# Altium schematic sheet esp32‑smart‑greenhouse.schdoc
size 309 x 223 mm; Symbol: Sheet-Symbol_A4; Device: Sheet-Symbol_A4; Company: 嘉立创EDA; Version: V1.0; Page Size: A4; @Project Name: ESP32-01-V1.05; @Page Count: 1; @Update Date: 2025-07-08; @Create Date: 2025-07-08; @Schematic Name: schematic1_1; @Page No: 1; @Page Name: P1; @Board Name: Board1; @Create Time: 15:48:50; @Update Time: 16:10:28
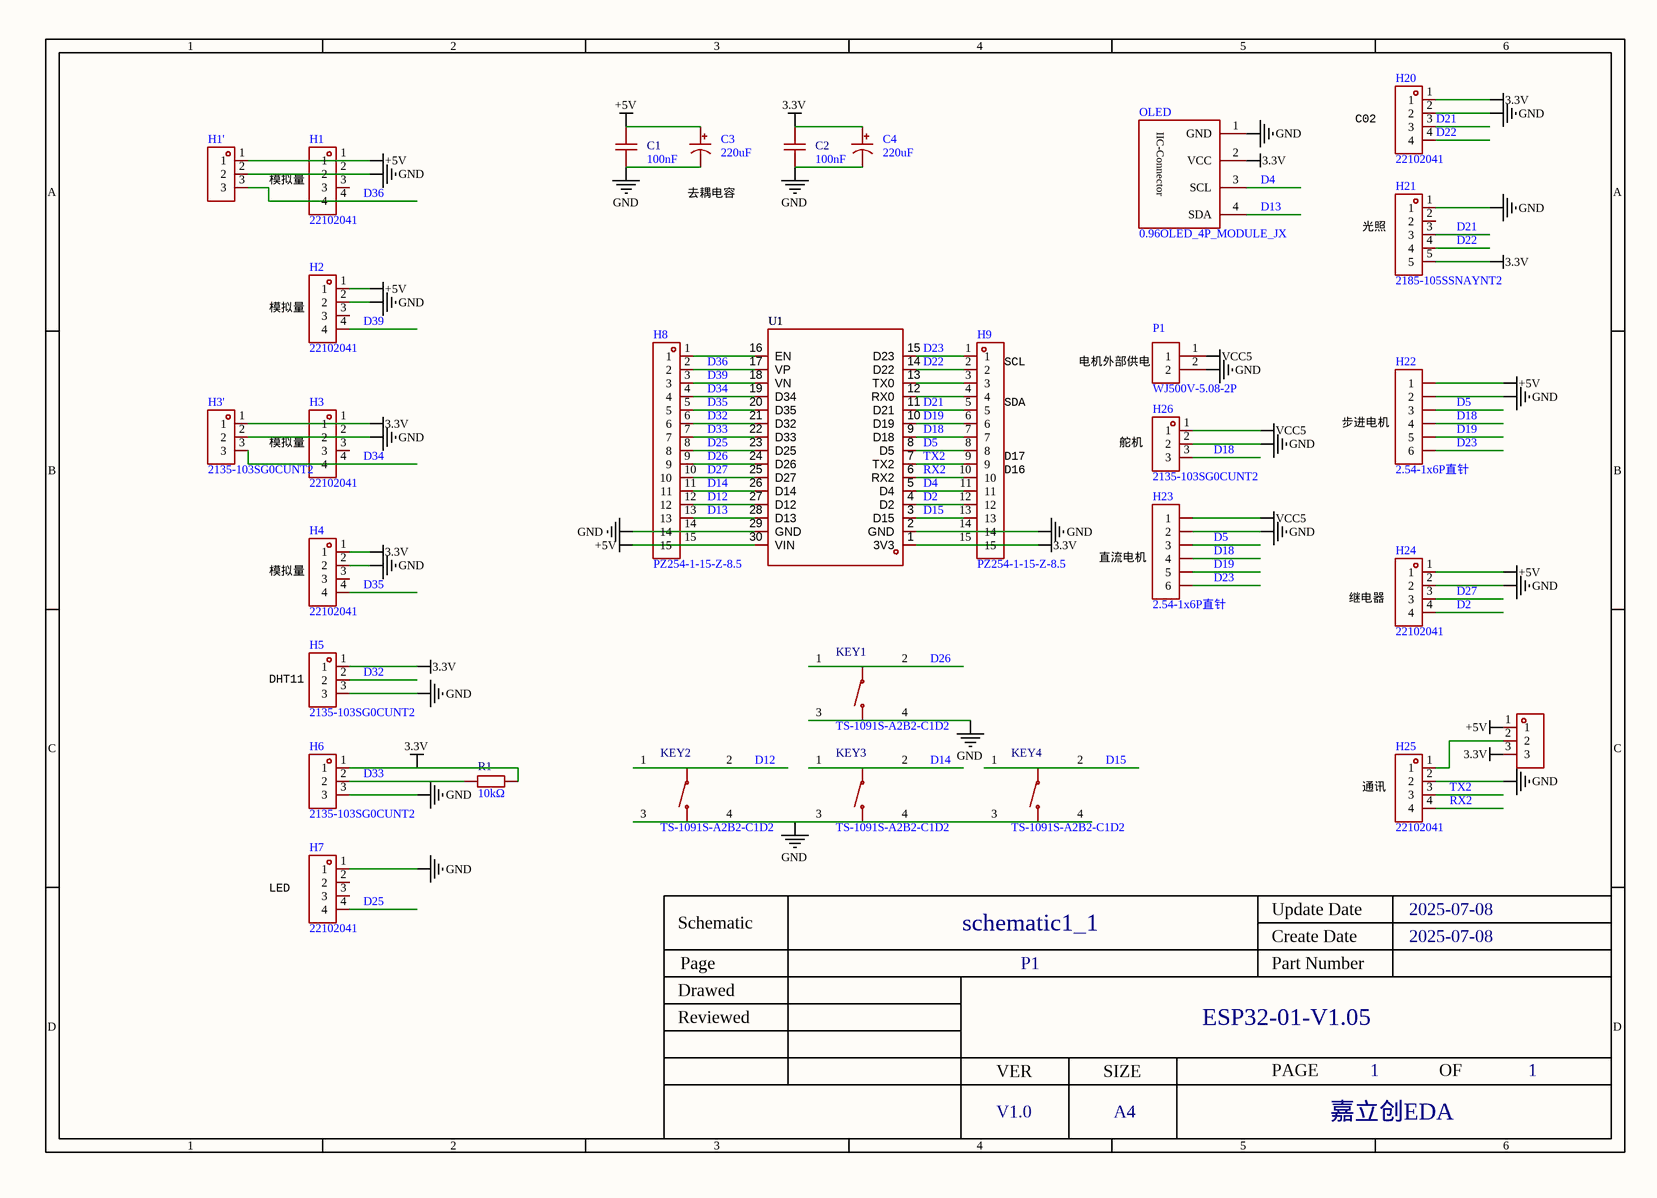
[diagram p0: esp32‑smart‑greenhouse.schdoc]

## Parts
C1  100nF  [C0805]
C2  100nF  [C0805]
C3  220uF  [CAP-TH_BD6.3-P2.50-D1.0-FD]
C4  220uF  [CAP-TH_BD6.3-P2.50-D1.0-FD]
H1  22102041  [HDR-TH_4P-P2.54-V-M]
H1'  2135-103SG0CUNT2  [HDR-TH_3P-P2.54-V-F]  (value not drawn)
H2  22102041  [HDR-TH_4P-P2.54-V-M]
H3  22102041  [HDR-TH_4P-P2.54-V-M]
H3'  2135-103SG0CUNT2  [HDR-TH_3P-P2.54-V-F]
H4  22102041  [HDR-TH_4P-P2.54-V-M]
H5  2135-103SG0CUNT2  [HDR-TH_3P-P2.54-V-F]
H6  2135-103SG0CUNT2  [HDR-TH_3P-P2.54-V-F]
H7  22102041  [HDR-TH_4P-P2.54-V-M]
H8  PZ254-1-15-Z-8.5  [HDR-TH_15P-P2.54-V-M]
H9  PZ254-1-15-Z-8.5  [HDR-TH_15P-P2.54-V-M]
H20  22102041  [HDR-TH_4P-P2.54-V-M]
H21  2185-105SSNAYNT2  [HDR-TH_5P-P2.54-V-F]
H22  2.54-1x6P直针  [HDR-TH_6P-P2.54-V-M-1]
H23  2.54-1x6P直针  [HDR-TH_6P-P2.54-V-M-1]
H24  22102041  [HDR-TH_4P-P2.54-V-M]
H25  22102041  [HDR-TH_4P-P2.54-V-M]
H26  2135-103SG0CUNT2  [HDR-TH_3P-P2.54-V-F]
H27  2135-103SG0CUNT2  [HDR-TH_3P-P2.54-V-F]  (value not drawn)
KEY1  TS-1091S-A2B2-C1D2  [SW-SMD_4P-L4.5-W4.5-P3.00-LS6.8]
KEY2  TS-1091S-A2B2-C1D2  [SW-SMD_4P-L4.5-W4.5-P3.00-LS6.8]
KEY3  TS-1091S-A2B2-C1D2  [SW-SMD_4P-L4.5-W4.5-P3.00-LS6.8]
KEY4  TS-1091S-A2B2-C1D2  [SW-SMD_4P-L4.5-W4.5-P3.00-LS6.8]
OLED  0.96OLED_4P_MODULE_JX  [0.96 OLED IIC]
P1  WJ500V-5.08-2P  [CONN-TH_2P-P5.00_WJ500V-5.08-2P]
R1  10kΩ  [R0805]
U1  (no value)  [ESP32-DEVKIT]

## Nets
3.3V: C2.2 C4.1 H3.1 H3'.1 H4.1 H5.1 H6.1 H9.15 H20.1 H21.5 H27.3 OLED.2(VCC) R1.2 U1.1(3V3)
+5V: C1.2 C3.1 H1.1 H1'.1 H2.1 H8.15 H22.1 H24.1 H27.1 U1.30(VIN)
GND: C1.1 C2.1 C3.2 C4.2 H1.2 H1'.2 H2.2 H3.2 H3'.2 H4.2 H5.3 H6.3 H7.1 H8.14 H9.14 H20.2 H21.1 H22.2 H23.2 H24.2 H25.2 H26.2 KEY1.3 KEY1.4 KEY2.3 KEY2.4 KEY3.3 KEY3.4 KEY4.3 KEY4.4 OLED.1(GND) P1.2 U1.2(GND) U1.29(GND)
VCC5: H23.1 H26.1 P1.1
D2: H9.12 H24.4 U1.4(D2)
D4: H9.11 OLED.3(SCL) U1.5(D4)
D5: H9.8 H22.3 H23.3 U1.8(D5)
D12: H8.12 KEY2.1 KEY2.2 U1.27(D12)
D13: H8.13 OLED.4(SDA) U1.28(D13)
D14: H8.11 KEY3.1 KEY3.2 U1.26(D14)
D15: H9.13 KEY4.1 KEY4.2 U1.3(D15)
D18: H9.7 H22.4 H23.4 H26.3 U1.9(D18)
D19: H9.6 H22.5 H23.5 U1.10(D19)
D21: H9.5 H20.3 H21.3 U1.11(D21)
D22: H9.2 H20.4 H21.4 U1.14(D22)
D23: H9.1 H22.6 H23.6 U1.15(D23)
D25: H7.4 H8.8 U1.23(D25)
D26: H8.9 KEY1.1 KEY1.2 U1.24(D26)
D27: H8.10 H24.3 U1.25(D27)
D32: H5.2 H8.6 U1.21(D32)
D33: H6.2 H8.7 R1.1 U1.22(D33)
D34: H3.4 H3'.3 H8.4 U1.19(D34)
D35: H4.4 H8.5 U1.20(D35)
D36: H1.4 H1'.3 H8.2 U1.17(VP)
D39: H2.4 H8.3 U1.18(VN)
RX2: H9.10 H25.4 U1.6(RX2)
TX2: H9.9 H25.3 U1.7(TX2)
NetH8_1: H8.1 U1.16(EN)
NetH9_3: H9.3 U1.13(TX0)
NetH9_4: H9.4 U1.12(RX0)
NetH25_1: H25.1 H27.2

Not connected (* = marked no-connect by the designer): H1 3; H2 3; H3 3; H4 3; H7 2 3; H21 2

## Notes on the sheet
- (near H20) C02
- 模拟量
- (near C3) 去耦电容
- (near H21) 光照
- (near H2) 模拟量
- (near H9) SCL
- (near H9) SDA
- 电机外部供电
- (near H9) D16
- (near H9) D17
- (near H26) 舵机
- 步进电机
- (near H4) 模拟量
- 直流电机
- 继电器
- (near H5) DHT11
- (near H25) 通讯
- (near H7) LED
- 1
- 2
- 3
- 4
- 5
- 6
- A
- B
- C
- Schematic
- schematic1_1
- Create Date
- Update Date
- 2025-07-08
- Reviewed
- Drawed
- Page
- P1
- Part Number
- ESP32-01-V1.05
- D
- VER
- SIZE
- PAGE
- OF
- V1.0
- A4
- 嘉立创EDA
- (in symbol 0.96OLED_4P_MODULE_JX) IIC-Connector

## Library data of the parts
C1 C2 = 0805B104K500NT: Manufacturer: FH(风华); Add into BOM: yes; Tolerance: ±10%; Voltage Rated: 50V; Temperature Coefficient: X7R; Symbol: 0805B104K500NT; Device: 0805B104K500NT; Supplier: LCSC; Manufacturer Part: 0805B104K500NT; Value: 100nF; Supplier Part: C38141; JLCPCB Part Class: 扩展库; LCSC Part Name: 100nF ±10% 50V; Supplier Footprint: 0805; Datasheet: https://atta.szlcsc.com/upload/public/pdf/source/20200305/C486355_26A10D38EF8C2A5C37091D0039909270.pdf; Convert to PCB: yes
C3 C4 = KM227M025E11RR0VH2FP0: Manufacturer: CX(承兴); Symbol: 220uF 25V_C12450; Add into BOM: yes; Tolerance: ±20%; Rated Voltage: 25V; φD: 6.3mm; L: 11mm; Lifetime @ Temp: 1000hrs@105℃; Device: KM227M025E11RR0VH2FP0; LCSC Part Name: 220uF ±20% 25V; Supplier Part: C12450; Manufacturer Part: KM227M025E11RR0VH2FP0; Supplier Footprint: 插件,D6.3xL11mm; JLCPCB Part Class: Extended Part; Datasheet: https://atta.szlcsc.com/upload/public/pdf/source/20211027/06D6BA3719C264B639DC286D935D03EA.pdf; Supplier: LCSC; Convert to PCB: yes; Value: 220uF; Lead Spacing: 2.5mm; Ripple Current: -; Equivalent Series Resistance(ESR): -
H1-H4 H7 H20 H24 H25 = 22102041: Manufacturer: MOLEX; Add into BOM: yes; Pitch: 2.54mm; Pin Structure: 1x4P; Circluar Pins/Square Pins: 方针; Symbol: 22102041; Device: 22102041; LCSC Part Name: 2.54mm 1x4P 直插 方针; Supplier Part: C587009; Manufacturer Part: 22102041; Supplier Footprint: 直插,P=2.54mm; JLCPCB Part Class: Extended Part; Datasheet: https://atta.szlcsc.com/upload/public/pdf/source/20200402/C505002_856223BAA9A0A89C9E5E2B091B4C4B1A.pdf; Supplier: LCSC; Convert to PCB: yes; Number of Pins: 4; Number of Rows: 1; Row Spacing: -; Mounting Type: 直插; Current Rating (Max): -; Voltage Rating (Max): -; Length of Mating Pin: 7.49mm; Insulation Height: 3.3mm; Length of End Connection Pin: 3.43mm; Contact Material: -; Operating Temperature Range: -; Color: -
H1' H3' H5 H6 H26 H27 = 2135-103SG0CUNT2: Manufacturer: Wcon(维峰电子); Add into BOM: yes; Pitch: 2.54mm; Number of Holes: 3; Holes Structure: 1x3P; Circular Hole / Square Hole: 方孔; Current Rating (Max): 3A; Voltage Rating (Max): 320V; Holes Direction: 顶部; Symbol: 2135-103SG0CUNT2; Device: 2135-103SG0CUNT2; LCSC Part Name: 2.54mm 1x3P; Supplier Part: C721782; Manufacturer Part: 2135-103SG0CUNT2; Supplier Footprint: 直插,P=2.54mm; JLCPCB Part Class: Extended Part; Datasheet: https://atta.szlcsc.com/upload/public/pdf/source/20200831/C721782_AFAF4F918CF4AB6BFC0BAFDF09758928.pdf; Supplier: LCSC; Convert to PCB: yes; Number of Rows: 1; Row Spacing: 2.54mm; Mounting Type: 直插; Insulation Height: 3.55mm; Contact Material: 磷青铜; Contact Plating: 金; Operating Temperature Range: -40℃~+105℃; Welding Temperature (Max): -
H8 H9 = PZ254-1-15-Z-8.5_C2894938: Manufacturer: HCTL(华灿天禄); Add into BOM: yes; Pitch: 2.54mm; Pin Structure: 1x15P; Circluar Pins/Square Pins: 方针; Current Rating (Max): 3A; Symbol: PZ254-1-15-Z-8.5; Device: PZ254-1-15-Z-8.5_C2894938; LCSC Part Name: 2.54mm 1x15P 直插 方针; Supplier Part: C2894938; Manufacturer Part: PZ254-1-15-Z-8.5; Supplier Footprint: 插件,P=2.54mm; JLCPCB Part Class: Extended Part; Datasheet: https://atta.szlcsc.com/upload/public/pdf/source/20210915/C60D3389AEF9552CB6A0EAA67D6CA963.pdf; Supplier: LCSC; Convert to PCB: yes; Number of Rows: 单排; Number of Pins: 15; Row Spacing: -; Mounting Type: 直插; Voltage Rating (Max): -; Length of Mating Pin: 6mm; Insulation Height: 2.5mm; Length of End Connection Pin: 3mm; Contact Material: -; Operating Temperature Range: -40℃~+105℃; Color: 黑色
H21 = 2185-105SSNAYNT2: Manufacturer: Wcon(维峰电子); Add into BOM: yes; Pitch: 2.54mm; Number of Holes: 5; Holes Structure: 1x5P; Circular Hole / Square Hole: 方孔; Current Rating (Max): 3A; Voltage Rating (Max): 320V; Holes Direction: 顶部; Symbol: 2185-105SSNAYNT2; Device: 2185-105SSNAYNT2; LCSC Part Name: 2.54mm 1x5P; Supplier Part: C721789; Manufacturer Part: 2185-105SSNAYNT2; Supplier Footprint: 直插,P=2.54mm; JLCPCB Part Class: Extended Part; Datasheet: https://atta.szlcsc.com/upload/public/pdf/source/20200814/C721789_B69A641D65EF4F3EE83CD5D7BC85F3DA.pdf; Supplier: LCSC; Convert to PCB: yes; Number of Rows: 1; Row Spacing: 2.54mm; Mounting Type: 直插; Insulation Height: 8.5mm; Contact Material: 磷青铜; Contact Plating: 锡; Operating Temperature Range: -40℃~+105℃; Welding Temperature (Max): -
H22 H23 = 2.54-1x6P直针: Manufacturer: BOOMELE(博穆精密); Symbol: Header-Male-2.54_1x6; Add into BOM: yes; Pitch: 2.54mm; Pin Structure: 1x6P; Circluar Pins/Square Pins: 方针; Current Rating (Max): 3A; Device: 2.54-1x6P直针; LCSC Part Name: 2.54mm 1x6P 直插 方针; Supplier Part: C37208; Manufacturer Part: 2.54-1x6P直针; Supplier Footprint: 直插,P=2.54mm; JLCPCB Part Class: Extended Part; Datasheet: https://atta.szlcsc.com/upload/public/pdf/source/20151109/1457707558014.pdf; Supplier: LCSC; Convert to PCB: yes; Number of Rows: 单排; Number of Pins: 6; Row Spacing: -; Mounting Type: 直插; Voltage Rating (Max): -; Length of Mating Pin: -; Insulation Height: -; Contact Material: 黄铜; Contact Plating: -; Operating Temperature Range: -40℃~+105℃; Color: 黑色
KEY1-KEY4 = TS-1091S-A2B2-C1D2: Manufacturer: Yuandi(元迪); Add into BOM: yes; Contact Current: 50mA; Voltage Rating (DC): 12V; Insulation Resistance: 100MΩ; Circuit: 单刀单掷; Actuator Style: 圆形按钮; Actuator/Cap Color: 黑色; Operating Force: 180gf@±30gf; Mechanical Life: 10万次; Switch Length: 4.5mm; Switch Height: 3.8mm; Symbol: TS-1091S-A2B2-C1D2; Device: TS-1091S-A2B2-C1D2; LCSC Part Name: 轻触开关4.5*4.5*3.8贴片四脚正按圆柄按键180gf; Supplier Part: C2972104; Manufacturer Part: TS-1091S-A2B2-C1D2; Supplier Footprint: SMD; JLCPCB Part Class: 扩展库; Datasheet: https://atta.szlcsc.com/upload/public/pdf/source/20220124/E36CE55B63FCC09C1B6C7E045CBF9EE5.pdf; Supplier: LCSC; Convert to PCB: yes; Operating Temperature: -25℃~+85℃; Switch Width: 4.5mm
OLED = 0.96OLED_4P_MODULE_JX: Add into BOM: yes; Symbol: 0.96OLED_4P_MODULE_JX; Device: 0.96OLED_4P_MODULE_JX; LCSC Part Name: 0.96OLED_4P_MODULE_JX; Supplier Part: C9900004566; Manufacturer Part: 0.96OLED_4P_MODULE_JX; Supplier Footprint: 插件; JLCPCB Part Class: Extended Part; Datasheet: https://atta.szlcsc.comnull; Supplier: LCSC; Convert to PCB: yes
P1 = WJ500V-5.08-2P: Manufacturer: KANGNEX(康奈克斯电气); Symbol: WJ500V-5.08-2P-14-00A; Add into BOM: yes; Pitch: 5.08mm; Structure: 1x2P; Number of PINs Per Row: 2; Current Rating (Max): 18A; Voltage Rating (Max): 250V; Wire Gauge - AWG: 14~30; Wire Gauge - mm2: 2.5; Device: WJ500V-5.08-2P; LCSC Part Name: 5.08mm 1x2P 排数:1 每排P数:2 直针 可拼接; Supplier Part: C8465; Manufacturer Part: WJ500V-5.08-2P; Supplier Footprint: 插件,P=5.08mm; JLCPCB Part Class: Extended Part; Datasheet: https://atta.szlcsc.com/upload/public/pdf/source/20191225/C8465_02D34CE5B5B4A53DF5891601D97FA9F4.pdf; Supplier: LCSC; Convert to PCB: yes; Number of Rows: 1; Mounting Style: 直针; Operating Temperature Range: -40℃~+105℃; Color: 绿色
R1 = 0805W8F1002T5E_C17414: Manufacturer: UNI-ROYAL(厚声); Add into BOM: yes; Tolerance: ±1%; Power(Watts): 125mW; Overload Voltage (Max): 150V; Temperature Coefficient: ±100ppm/℃; Symbol: 0805W8F1002T5E; Device: 0805W8F1002T5E_C17414; Supplier: LCSC; Manufacturer Part: 0805W8F1002T5E; Supplier Part: C17414; Value: 10kΩ; JLCPCB Part Class: 基础库; LCSC Part Name: 10kΩ ±1% 125mW 厚膜电阻; Supplier Footprint: 0805; Datasheet: https://atta.szlcsc.com/upload/public/pdf/source/20200306/C422600_1E6D84923E4A46A82E41ADD87F860B5C.pdf; Convert to PCB: yes; Type: 厚膜电阻; Operating Temperature Range: -55℃~+155℃
U1 = ESP32: Symbol: ESP32; Device: ESP32